# Altium schematic sheet Sheet2.SchDoc
size A4
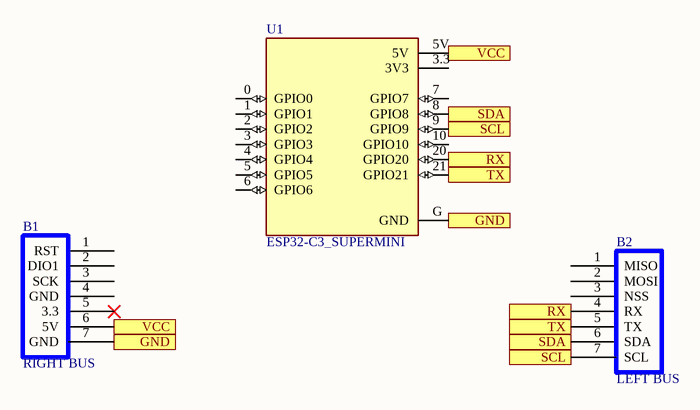
[diagram p0: Sheet2.SchDoc]

## Parts
B1  RIGHT BUS  [bus left]
B2  LEFT BUS  [bus right]
U1  ESP32-C3_SUPERMINI  [MODULE_ESP32-C3_SUPERMINI]

## Ports
GND, RX, SCL, SDA, TX, VCC

## Nets
GND: B1.7(GND) U1.G(GND) ; port GND
RX: B2.4(RX) U1.20(GPIO20) ; port RX
SCL: B2.7(SCL) U1.9(GPIO9) ; port SCL
SDA: B2.6(SDA) U1.8(GPIO8) ; port SDA
TX: B2.5(TX) U1.21(GPIO21) ; port TX
VCC: B1.6(5V) U1.5V ; port VCC

Not connected (* = marked no-connect by the designer): B1 1(RST) 2(DIO1) 3(SCK) 4(_GND) 5(3.3)*; B2 1(MISO) 2(MOSI) 3(NSS); U1 0(GPIO0) 1(GPIO1) 2(GPIO2) 3(GPIO3) 3.3(3V3) 4(GPIO4) 5(GPIO5) 6(GPIO6) 7(GPIO7) 10(GPIO10)

## Library data of the parts
B1 = BUS right
B2 = BUS left
U1 = ESP32-C3_SUPERMINI: Super tiny ESP32-C3 board; MF: Espressif Systems; MP: ESP32-C3 SuperMini; SnapEDA_Link: https://www.snapeda.com/parts/ESP32-C3%20SuperMini/Espressif+Systems/view-part/?ref=snap; Package: Package; Value: *; Check_prices: https://www.snapeda.com/parts/ESP32-C3%20SuperMini/Espressif+Systems/view-part/?ref=eda